# Altium schematic sheet Solar_Part.SchDoc
size A4; SheetNumber: 17; SheetTotal: 17
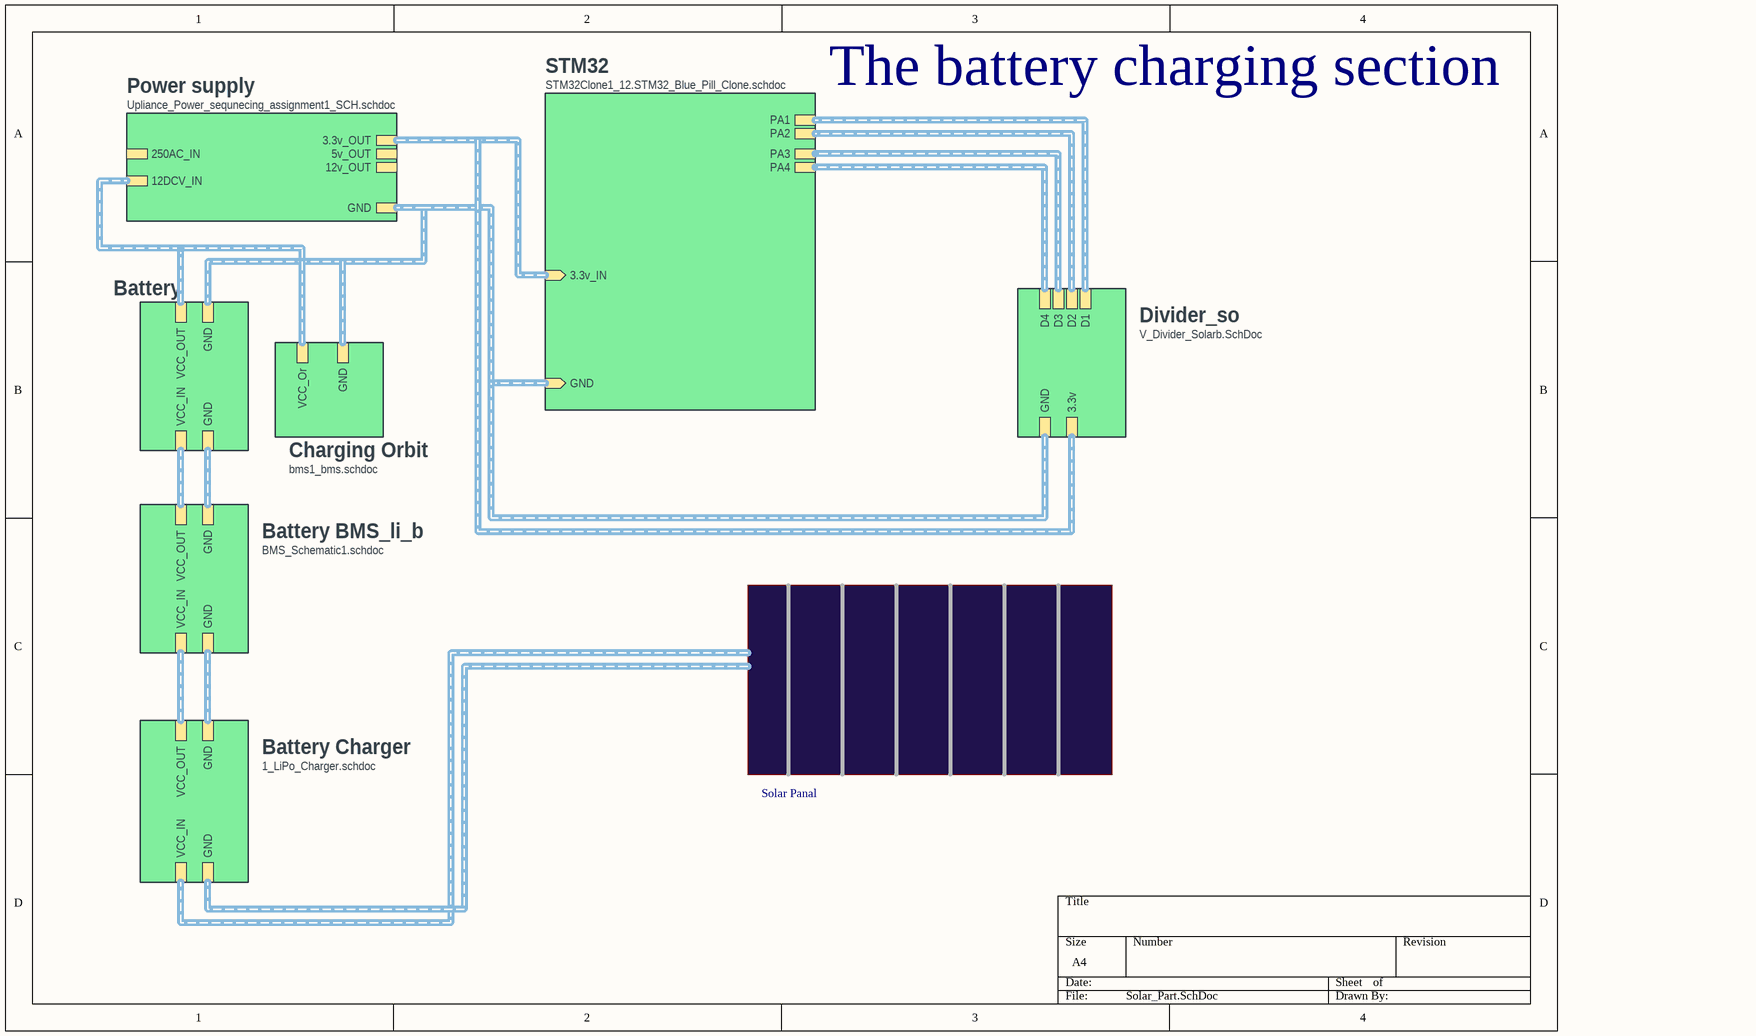
[diagram p0: Solar_Part.SchDoc]

## Sub-sheets
Battery = ?: VCC_IN (harness TWI), GND (harness TWI), VCC_OUT (harness USB_CC), GND (harness USB_CC)
Battery BMS_li_b = BMS_Schematic1.schdoc: VCC_IN (harness TWI), GND (harness TWI), VCC_OUT (harness USB_CC), GND (harness USB_CC)
Battery Charger = 1_LiPo_Charger.schdoc: GND (harness TWI), VCC_IN (harness TWI), VCC_OUT (harness USB_CC), GND (harness USB_CC)
Charging Orbit = bms1_bms.schdoc: GND (harness USB_CC), VCC_Or (harness USB_CC)
Divider_so = V_Divider_Solarb.SchDoc: D3 (harness USB_CC), D4 (harness USB_CC), D2 (harness USB_CC), D1 (harness USB_CC), GND (harness TWI), 3.3v (harness TWI)
Power supply = Upliance_Power_sequnecing_assignment1_SCH.schdoc: 12DCV_IN (harness TWI), 3.3v_OUT (harness USB_CC), GND (harness USB_CC), 5v_OUT (harness USB_CC), 12v_OUT (harness USB_CC), 250AC_IN (harness TWI)
STM32 = STM32Clone1_12.STM32_Blue_Pill_Clone.schdoc: PA1 (harness SWD), PA2 (harness TRACE), GND (in), 3.3v_IN (in), PA4 (harness GPIO_P0), PA3 (harness GPIO_P0)

## Buses and harness runs
harness sheet Battery BMS_li_b/GND = sheet Battery Charger/GND
harness sheet Battery BMS_li_b/GND = sheet Battery/GND
harness sheet Battery BMS_li_b/VCC_IN = sheet Battery Charger/VCC_OUT
harness sheet Battery BMS_li_b/VCC_OUT = sheet Battery/VCC_IN
harness sheet Battery/GND = sheet Charging Orbit/GND = sheet Divider_so/GND = sheet Power supply/GND = sheet STM32/GND
harness sheet Battery/VCC_OUT = sheet Charging Orbit/VCC_Or = sheet Power supply/12DCV_IN
harness sheet Divider_so/3.3v = sheet Power supply/3.3v_OUT = sheet STM32/3.3v_IN
harness sheet Divider_so/D1 = sheet STM32/PA1
harness sheet Divider_so/D2 = sheet STM32/PA2
harness sheet Divider_so/D3 = sheet STM32/PA3
harness sheet Divider_so/D4 = sheet STM32/PA4

## Notes on the sheet
- The battery charging section
- Solar Panal